# Altium schematic sheet Top-Sheet.SchDoc
size A4; SheetNumber: 1; SheetTotal: 5
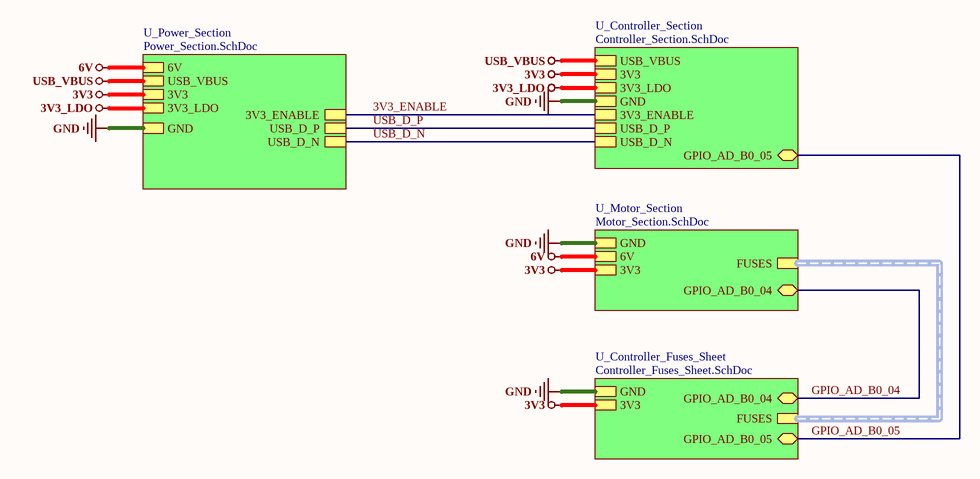
[diagram p0: Top-Sheet.SchDoc]

## Sub-sheets
U_Controller_Fuses_Sheet = Controller_Fuses_Sheet.SchDoc: FUSES (harness FUSES), GND, 3V3, GPIO_AD_B0_04 (bidir), GPIO_AD_B0_05 (bidir)
U_Controller_Section = Controller_Section.SchDoc: GND, USB_VBUS, 3V3, USB_D_N, USB_D_P, 3V3_ENABLE, 3V3_LDO, GPIO_AD_B0_05 (bidir)
U_Motor_Section = Motor_Section.SchDoc: GND, 6V, 3V3, FUSES (harness FUSES), GPIO_AD_B0_04 (bidir)
U_Power_Section = Power_Section.SchDoc: GND, USB_VBUS, 3V3, 6V, USB_D_P, USB_D_N, 3V3_ENABLE, 3V3_LDO

## Nets
3V3: sheet U_Power_Section/3V3, sheet U_Controller_Fuses_Sheet/3V3, sheet U_Motor_Section/3V3, sheet U_Controller_Section/3V3
3V3_LDO: sheet U_Power_Section/3V3_LDO, sheet U_Controller_Section/3V3_LDO
6V: sheet U_Power_Section/6V, sheet U_Motor_Section/6V
GND: sheet U_Power_Section/GND, sheet U_Controller_Fuses_Sheet/GND, sheet U_Motor_Section/GND, sheet U_Controller_Section/GND
USB_VBUS: sheet U_Power_Section/USB_VBUS, sheet U_Controller_Section/USB_VBUS
3V3_ENABLE: sheet U_Power_Section/3V3_ENABLE, sheet U_Controller_Section/3V3_ENABLE
GPIO_AD_B0_04: sheet U_Controller_Fuses_Sheet/GPIO_AD_B0_04, sheet U_Motor_Section/GPIO_AD_B0_04
GPIO_AD_B0_05: sheet U_Controller_Fuses_Sheet/GPIO_AD_B0_05, sheet U_Controller_Section/GPIO_AD_B0_05
USB_D_N: sheet U_Power_Section/USB_D_N, sheet U_Controller_Section/USB_D_N
USB_D_P: sheet U_Power_Section/USB_D_P, sheet U_Controller_Section/USB_D_P

## Buses and harness runs
harness sheet U_Controller_Fuses_Sheet/FUSES = sheet U_Motor_Section/FUSES

## Notes on the sheet
- File:
- Title:
- Date:
- Page
- Num:
- Total:
- Drawn By: Huzaifa Ali